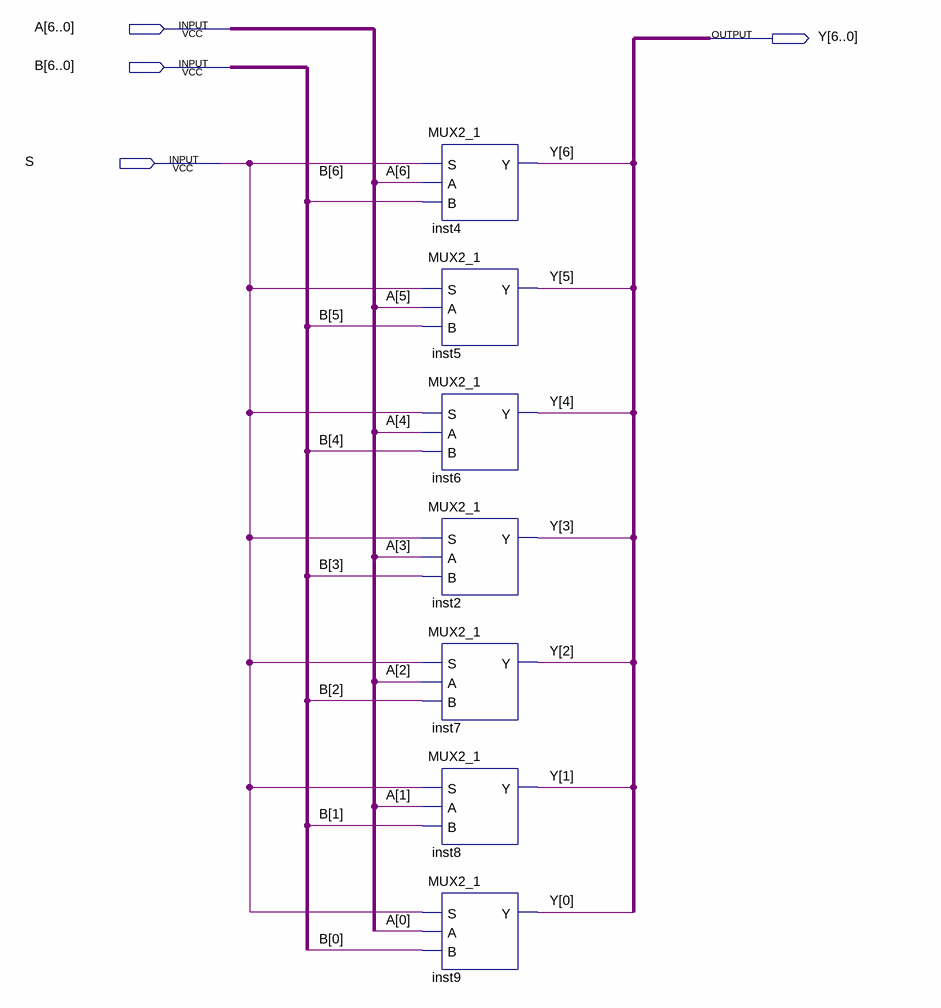
[diagram p0: schematic sheet]
// Quartus schematic MUX2_1_data_7_bit.bdf as structural Verilog: 7 symbols, 4 pins
module MUX2_1_data_7_bit (
  input  [6:0] A,
  input  [6:0] B,
  input  S,
  output [6:0] Y
);

  MUX2_1 inst4 (.S(S), .A(A[6]), .B(B[6]), .Y(Y[6]));
  MUX2_1 inst5 (.S(S), .A(A[5]), .B(B[5]), .Y(Y[5]));
  MUX2_1 inst6 (.S(S), .A(A[4]), .B(B[4]), .Y(Y[4]));
  MUX2_1 inst2 (.S(S), .A(A[3]), .B(B[3]), .Y(Y[3]));
  MUX2_1 inst7 (.S(S), .A(A[2]), .B(B[2]), .Y(Y[2]));
  MUX2_1 inst8 (.S(S), .A(A[1]), .B(B[1]), .Y(Y[1]));
  MUX2_1 inst9 (.S(S), .A(A[0]), .B(B[0]), .Y(Y[0]));
endmodule
